# Altium schematic sheet Sheet1.SchDoc
size A; SheetNumber: 1; SheetTotal: 2
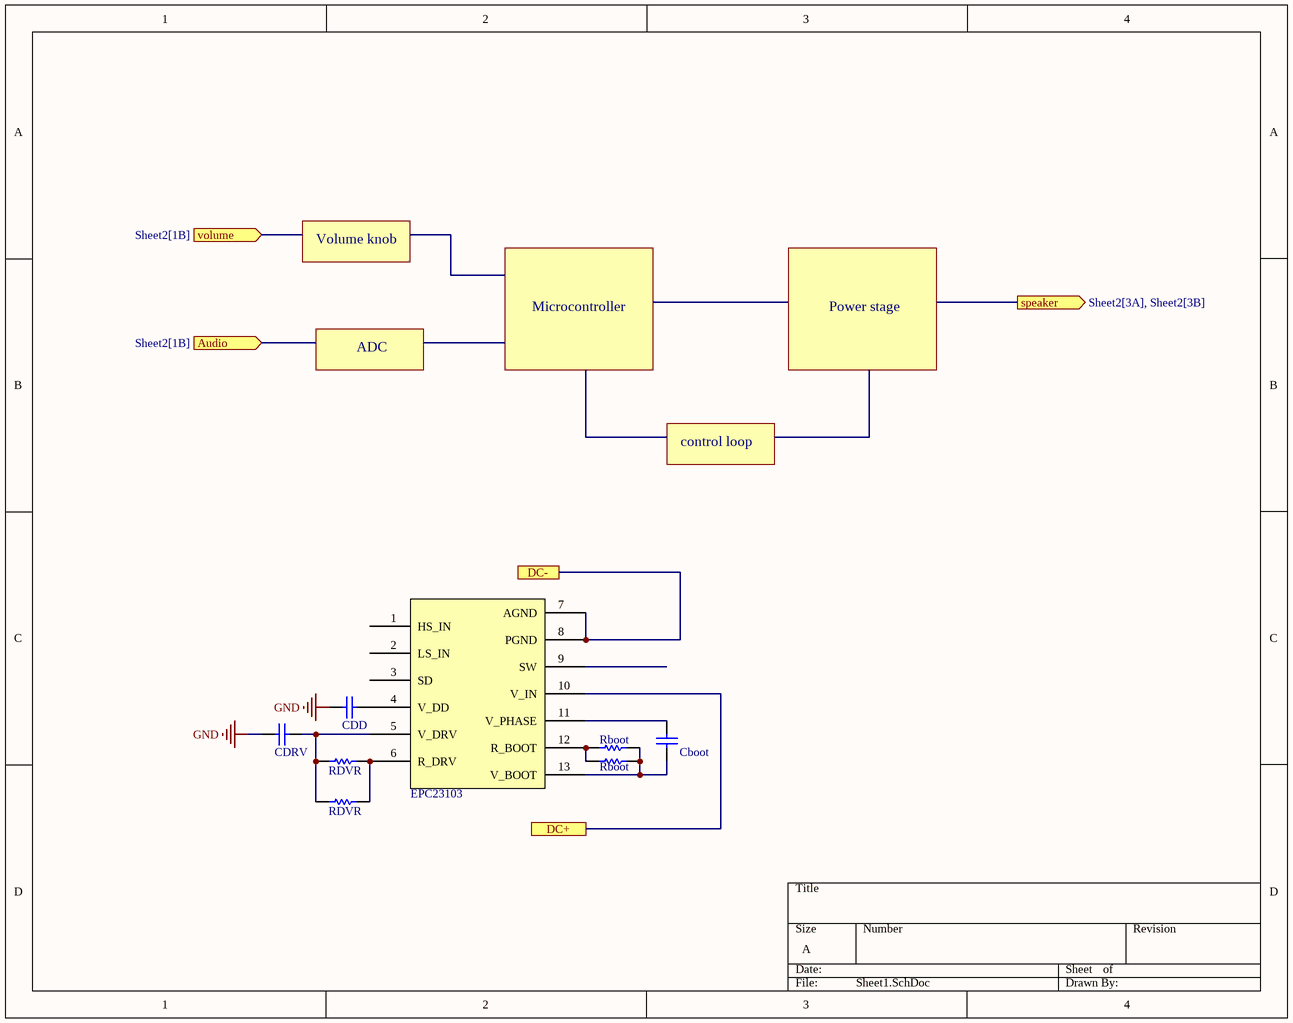
[diagram p0: Sheet1.SchDoc]

## Parts
(Parts that share a designator on the sheet are numbered #1, #2 ... from top to bottom, then left to right.)
C?#1  CDD  [0603 CAPACITOR]
C?#2  CDRV  [0603 CAPACITOR]
C?#3  Cboot  [0603 CAPACITOR]
Q?  EPC23103  [13-WQFN-HR]
R?#1  Rboot  [0603 RESISTOR]
R?#2  RDVR  [0603 RESISTOR]
R?#3  Rboot  [0603 RESISTOR]
R?#4  RDVR  [0603 RESISTOR]

## Ports
Audio (in, see Sheet2[1B]), DC+, DC-, speaker (out, see Sheet2[3A], Sheet2[3B]), volume (in, see Sheet2[1B])

## Nets
GND: C?#1.1 C?#2.1
DC+: Q?.10(V_IN) ; port DC+
DC-: Q?.7(AGND) Q?.8(PGND) ; port DC-
NetC?#1_2: C?#1.2 Q?.4(V_DD)
NetC?#2_2: C?#2.2 Q?.5(V_DRV) R?#2.2 R?#4.2
NetC?#3_1: C?#3.1 Q?.11(V_PHASE)
NetC?#3_2: C?#3.2 Q?.13(V_BOOT) R?#1.1 R?#3.1
NetQ?_6: Q?.6(R_DRV) R?#2.1 R?#4.1
NetQ?_12: Q?.12(R_BOOT) R?#1.2 R?#3.2

Not connected (* = marked no-connect by the designer): Q? 1(HS_IN) 2(LS_IN) 3(SD) 9(SW)

## Notes on the sheet
- Volume knob
- ADC
- Microcontroller
- Power stage
- control loop

## Library data of the parts
C?#1 = Temp Cap_Cdd: CDD from EPC23103 datasheet, 2.2 uF, 25V, 0603, GRT188C81E225KE13D; Manufacturer: Taiyo Yuden; Manufacturer Part Number: EMK212BB7106MG-T; Capacitance: 10uF; Voltage Rating: 16V; Tolerance: 20%; Dielectric: X7R; RoHS: Yes; Category: Ceramic Capacitors; Stock 1: 141084; Pricing 1: 3000=0.11489 (USD); Mount: Surface Mount; Case/Package: 0805; Case Code (Metric): 2012; Case Code (Imperial): 0805; Min Operating Temperature: -55°C; Max Operating Temperature: 125°C; Package Quantity: 3000; Packaging: Tape and Reel; Voltage Rating (DC): 16V; Termination: SMD/SMT; Resistor Type: Ceramic; Length: 2mm; Width: 0.049inch; Height: 1.25mm; Thickness: 0.053inch; Ratings: AEC-Q200; Halogen Free: Halogen Free; RoHS Compliant: Yes; ComponentLink1URL: https://datasheet.ciiva.com/24393/472emk212bb7106mg-t-24393497.pdf?src-supplier=Onlinecomponents.com; ComponentLink1Description: https://datasheet.ciiva.com/24393/472emk212bb7106mg-t-24393497.pdf?src-supplier=Onlinecomponents.com; ComponentLink2URL: https://datasheet.ciiva.com/30229/379emk212bb7106mg-t-30229719.pdf?src-supplier=Onlinecomponents.com; ComponentLink2Description: https://datasheet.ciiva.com/30229/379emk212bb7106mg-t-30229719.pdf?src-supplier=Onlinecomponents.com; ComponentLink3URL: https://datasheet.ciiva.com/18697/mlcc-all-e-18697736.pdf?src-supplier=Digi-Key; ComponentLink3Description: https://datasheet.ciiva.com/18697/mlcc-all-e-18697736.pdf?src-supplier=Digi-Key; ComponentLink4URL: https://datasheet.ciiva.com/18697/mlcc-all-e-18697735.pdf?src-supplier=Digi-Key; ComponentLink4Description: https://datasheet.ciiva.com/18697/mlcc-all-e-18697735.pdf?src-supplier=Digi-Key; ComponentLink5URL: https://datasheet.ciiva.com/18697/mlcc-all-e-18697737.pdf?src-supplier=Digi-Key; ComponentLink5Description: https://datasheet.ciiva.com/18697/mlcc-all-e-18697737.pdf?src-supplier=Digi-Key; ComponentLink6URL: https://datasheet.ciiva.com/15376/mlcc01-e-15376088.pdf?src-supplier=Mouser; ComponentLink6Description: https://datasheet.ciiva.com/15376/mlcc01-e-15376088.pdf?src-supplier=Mouser
C?#2 = Temp Cap_CDRV: CDRV from EPC23103 datasheet, 2.2 uF, 25V, 0603, GRT188C81E225KE13D; Manufacturer: Taiyo Yuden; Manufacturer Part Number: EMK212BB7106MG-T; Capacitance: 10uF; Voltage Rating: 16V; Tolerance: 20%; Dielectric: X7R; RoHS: Yes; Category: Ceramic Capacitors; Stock 1: 141084; Pricing 1: 3000=0.11489 (USD); Mount: Surface Mount; Case/Package: 0805; Case Code (Metric): 2012; Case Code (Imperial): 0805; Min Operating Temperature: -55°C; Max Operating Temperature: 125°C; Package Quantity: 3000; Packaging: Tape and Reel; Voltage Rating (DC): 16V; Termination: SMD/SMT; Resistor Type: Ceramic; Length: 2mm; Width: 0.049inch; Height: 1.25mm; Thickness: 0.053inch; Ratings: AEC-Q200; Halogen Free: Halogen Free; RoHS Compliant: Yes; ComponentLink1URL: https://datasheet.ciiva.com/24393/472emk212bb7106mg-t-24393497.pdf?src-supplier=Onlinecomponents.com; ComponentLink1Description: https://datasheet.ciiva.com/24393/472emk212bb7106mg-t-24393497.pdf?src-supplier=Onlinecomponents.com; ComponentLink2URL: https://datasheet.ciiva.com/30229/379emk212bb7106mg-t-30229719.pdf?src-supplier=Onlinecomponents.com; ComponentLink2Description: https://datasheet.ciiva.com/30229/379emk212bb7106mg-t-30229719.pdf?src-supplier=Onlinecomponents.com; ComponentLink3URL: https://datasheet.ciiva.com/18697/mlcc-all-e-18697736.pdf?src-supplier=Digi-Key; ComponentLink3Description: https://datasheet.ciiva.com/18697/mlcc-all-e-18697736.pdf?src-supplier=Digi-Key; ComponentLink4URL: https://datasheet.ciiva.com/18697/mlcc-all-e-18697735.pdf?src-supplier=Digi-Key; ComponentLink4Description: https://datasheet.ciiva.com/18697/mlcc-all-e-18697735.pdf?src-supplier=Digi-Key; ComponentLink5URL: https://datasheet.ciiva.com/18697/mlcc-all-e-18697737.pdf?src-supplier=Digi-Key; ComponentLink5Description: https://datasheet.ciiva.com/18697/mlcc-all-e-18697737.pdf?src-supplier=Digi-Key; ComponentLink6URL: https://datasheet.ciiva.com/15376/mlcc01-e-15376088.pdf?src-supplier=Mouser; ComponentLink6Description: https://datasheet.ciiva.com/15376/mlcc01-e-15376088.pdf?src-supplier=Mouser
C?#3 = Temp Cap_Cboot: Cboot, 100 nF, 25V, 0603. VJ0603Y104KXXCW1BC; Manufacturer: Taiyo Yuden; Manufacturer Part Number: EMK212BB7106MG-T; Capacitance: 10uF; Voltage Rating: 16V; Tolerance: 20%; Dielectric: X7R; RoHS: Yes; Category: Ceramic Capacitors; Stock 1: 141084; Pricing 1: 3000=0.11489 (USD); Mount: Surface Mount; Case/Package: 0805; Case Code (Metric): 2012; Case Code (Imperial): 0805; Min Operating Temperature: -55°C; Max Operating Temperature: 125°C; Package Quantity: 3000; Packaging: Tape and Reel; Voltage Rating (DC): 16V; Termination: SMD/SMT; Resistor Type: Ceramic; Length: 2mm; Width: 0.049inch; Height: 1.25mm; Thickness: 0.053inch; Ratings: AEC-Q200; Halogen Free: Halogen Free; RoHS Compliant: Yes; ComponentLink1URL: https://datasheet.ciiva.com/24393/472emk212bb7106mg-t-24393497.pdf?src-supplier=Onlinecomponents.com; ComponentLink1Description: https://datasheet.ciiva.com/24393/472emk212bb7106mg-t-24393497.pdf?src-supplier=Onlinecomponents.com; ComponentLink2URL: https://datasheet.ciiva.com/30229/379emk212bb7106mg-t-30229719.pdf?src-supplier=Onlinecomponents.com; ComponentLink2Description: https://datasheet.ciiva.com/30229/379emk212bb7106mg-t-30229719.pdf?src-supplier=Onlinecomponents.com; ComponentLink3URL: https://datasheet.ciiva.com/18697/mlcc-all-e-18697736.pdf?src-supplier=Digi-Key; ComponentLink3Description: https://datasheet.ciiva.com/18697/mlcc-all-e-18697736.pdf?src-supplier=Digi-Key; ComponentLink4URL: https://datasheet.ciiva.com/18697/mlcc-all-e-18697735.pdf?src-supplier=Digi-Key; ComponentLink4Description: https://datasheet.ciiva.com/18697/mlcc-all-e-18697735.pdf?src-supplier=Digi-Key; ComponentLink5URL: https://datasheet.ciiva.com/18697/mlcc-all-e-18697737.pdf?src-supplier=Digi-Key; ComponentLink5Description: https://datasheet.ciiva.com/18697/mlcc-all-e-18697737.pdf?src-supplier=Digi-Key; ComponentLink6URL: https://datasheet.ciiva.com/15376/mlcc01-e-15376088.pdf?src-supplier=Mouser; ComponentLink6Description: https://datasheet.ciiva.com/15376/mlcc01-e-15376088.pdf?src-supplier=Mouser
Q? = EPC23103: IC GAN EPOWER STAGE 100V 20A
R?#1 R?#3 = Temp Resistor_Rboot: Rboot from EPC23103, 2.2 ohms, 0603, / ERJ-3GEYJ2R2V; Mounting Type: Surface Mount
R?#2 R?#4 = Temp Resistor_RDVR: RDVR from EPC23103, 2.2 ohms, 0603, / ERJ-3GEYJ2R2V; Mounting Type: Surface Mount